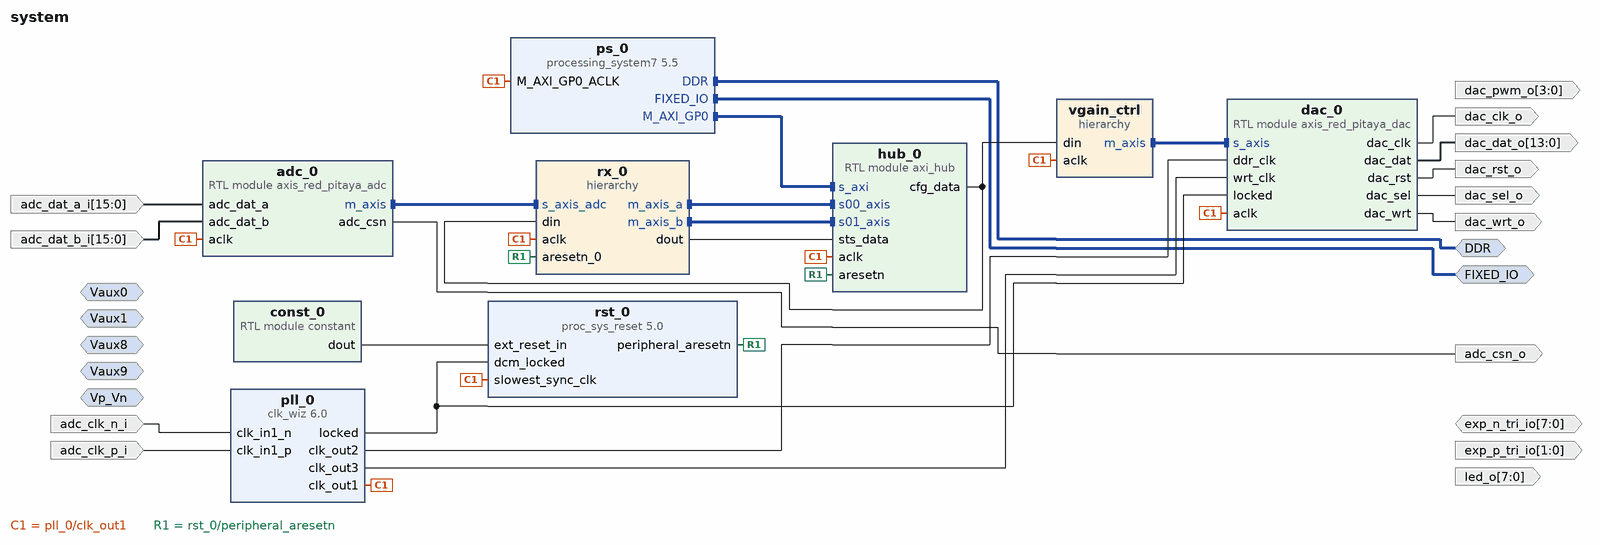
[diagram p0: block diagram of the top level]
# Vivado block design system, xc7z010clg400-1, Vivado 2025.2
create_bd_design system

create_bd_intf_port -mode Slave -vlnv xilinx.com:interface:diff_analog_io_rtl:1.0 Vp_Vn
create_bd_intf_port -mode Slave -vlnv xilinx.com:interface:diff_analog_io_rtl:1.0 Vaux0
create_bd_intf_port -mode Slave -vlnv xilinx.com:interface:diff_analog_io_rtl:1.0 Vaux1
create_bd_intf_port -mode Slave -vlnv xilinx.com:interface:diff_analog_io_rtl:1.0 Vaux9
create_bd_intf_port -mode Slave -vlnv xilinx.com:interface:diff_analog_io_rtl:1.0 Vaux8
create_bd_intf_port -mode Master -vlnv xilinx.com:interface:ddrx_rtl:1.0 DDR
create_bd_intf_port -mode Master -vlnv xilinx.com:display_processing_system7:fixedio_rtl:1.0 FIXED_IO
create_bd_port -dir I -from 15 -to 0 adc_dat_a_i
create_bd_port -dir I -from 15 -to 0 adc_dat_b_i
create_bd_port -dir I adc_clk_p_i
create_bd_port -dir I adc_clk_n_i
create_bd_port -dir O adc_csn_o
create_bd_port -dir O -from 13 -to 0 dac_dat_o
create_bd_port -dir O dac_clk_o
create_bd_port -dir O dac_rst_o
create_bd_port -dir O dac_sel_o
create_bd_port -dir O dac_wrt_o
create_bd_port -dir O -from 3 -to 0 dac_pwm_o
create_bd_port -dir IO -from 7 -to 0 exp_n_tri_io
create_bd_port -dir O -from 7 -to 0 led_o
create_bd_port -dir O -from 1 -to 0 exp_p_tri_io

create_bd_cell -type ip -vlnv xilinx.com:ip:clk_wiz:6.0 pll_0
set_property -dict [list \
  CONFIG.CLKOUT1_REQUESTED_OUT_FREQ 125.0 \
  CONFIG.CLKOUT1_USED true \
  CONFIG.CLKOUT2_REQUESTED_OUT_FREQ 250.0 \
  CONFIG.CLKOUT2_REQUESTED_PHASE 157.5 \
  CONFIG.CLKOUT2_USED true \
  CONFIG.CLKOUT3_REQUESTED_OUT_FREQ 250.0 \
  CONFIG.CLKOUT3_REQUESTED_PHASE 202.5 \
  CONFIG.CLKOUT3_USED true \
  CONFIG.PRIMITIVE PLL \
  CONFIG.PRIM_IN_FREQ 125.0 \
  CONFIG.PRIM_SOURCE Differential_clock_capable_pin \
  CONFIG.USE_RESET false \
] [get_bd_cells pll_0]
create_bd_cell -type ip -vlnv xilinx.com:ip:processing_system7:5.5 ps_0
set_property -dict [list \
  CONFIG.PCW_APU_PERIPHERAL_FREQMHZ 666.666666 \
  CONFIG.PCW_ENET0_ENET0_IO {MIO 16 .. 27} \
  CONFIG.PCW_ENET0_GRP_MDIO_ENABLE 1 \
  CONFIG.PCW_ENET0_GRP_MDIO_IO {MIO 52 .. 53} \
  CONFIG.PCW_ENET0_PERIPHERAL_ENABLE 1 \
  CONFIG.PCW_ENET0_RESET_ENABLE 0 \
  CONFIG.PCW_ENET_RESET_ENABLE 1 \
  CONFIG.PCW_ENET_RESET_SELECT {Share reset pin} \
  CONFIG.PCW_FPGA0_PERIPHERAL_FREQMHZ 50 \
  CONFIG.PCW_FPGA1_PERIPHERAL_FREQMHZ 50 \
  CONFIG.PCW_GPIO_EMIO_GPIO_ENABLE 1 \
  CONFIG.PCW_GPIO_EMIO_GPIO_IO 64 \
  CONFIG.PCW_GPIO_MIO_GPIO_ENABLE 1 \
  CONFIG.PCW_GPIO_MIO_GPIO_IO MIO \
  CONFIG.PCW_GPIO_PERIPHERAL_ENABLE 1 \
  CONFIG.PCW_I2C0_GRP_INT_ENABLE 0 \
  CONFIG.PCW_I2C0_I2C0_IO {MIO 50 .. 51} \
  CONFIG.PCW_I2C0_PERIPHERAL_ENABLE 1 \
  CONFIG.PCW_I2C_PERIPHERAL_FREQMHZ 111.111115 \
  CONFIG.PCW_I2C_RESET_ENABLE 1 \
  CONFIG.PCW_I2C_RESET_SELECT {Share reset pin} \
  CONFIG.PCW_IMPORT_BOARD_PRESET cfg/red_pitaya.xml \
  CONFIG.PCW_PRESET_BANK1_VOLTAGE {LVCMOS 2.5V} \
  CONFIG.PCW_QSPI_PERIPHERAL_ENABLE 0 \
  CONFIG.PCW_SD0_GRP_CD_ENABLE 1 \
  CONFIG.PCW_SD0_GRP_CD_IO {MIO 46} \
  CONFIG.PCW_SD0_GRP_WP_ENABLE 1 \
  CONFIG.PCW_SD0_GRP_WP_IO {MIO 47} \
  CONFIG.PCW_SD0_PERIPHERAL_ENABLE 1 \
  CONFIG.PCW_SD0_SD0_IO {MIO 40 .. 45} \
  CONFIG.PCW_SDIO_PERIPHERAL_FREQMHZ 100 \
  CONFIG.PCW_SPI0_PERIPHERAL_ENABLE 1 \
  CONFIG.PCW_SPI0_SPI0_IO EMIO \
  CONFIG.PCW_SPI1_PERIPHERAL_ENABLE 1 \
  CONFIG.PCW_SPI1_SPI1_IO {MIO 10 .. 15} \
  CONFIG.PCW_UART0_PERIPHERAL_ENABLE 1 \
  CONFIG.PCW_UART0_UART0_IO {MIO 14 .. 15} \
  CONFIG.PCW_UART1_PERIPHERAL_ENABLE 1 \
  CONFIG.PCW_UART1_UART1_IO {MIO 8 .. 9} \
  CONFIG.PCW_UART_PERIPHERAL_FREQMHZ 100 \
  CONFIG.PCW_UIPARAM_DDR_BUS_WIDTH {16 Bit} \
  CONFIG.PCW_UIPARAM_DDR_FREQ_MHZ 533.333333 \
  CONFIG.PCW_UIPARAM_DDR_PARTNO {MT41J256M16 RE-125} \
  CONFIG.PCW_USB0_PERIPHERAL_ENABLE 1 \
  CONFIG.PCW_USB0_RESET_ENABLE 1 \
  CONFIG.PCW_USB0_RESET_IO {MIO 48} \
  CONFIG.PCW_USB0_USB0_IO {MIO 28 .. 39} \
  CONFIG.PCW_USB_RESET_ENABLE 1 \
  CONFIG.PCW_USB_RESET_SELECT {Share reset pin} \
] [get_bd_cells ps_0]
# 431 more settings of ps_0 are not shown: defaults, MIO pin electricals, DDR timing, and values the tool derives
create_bd_cell -type module -reference constant const_0
create_bd_cell -type ip -vlnv xilinx.com:ip:proc_sys_reset:5.0 rst_0
create_bd_cell -type module -reference axis_red_pitaya_adc adc_0
set_property -dict {CONFIG.ADC_DATA_WIDTH 14} [get_bd_cells adc_0]
create_bd_cell -type module -reference axis_red_pitaya_dac dac_0
set_property -dict {CONFIG.DAC_DATA_WIDTH 14} [get_bd_cells dac_0]
create_bd_cell -type hier rx_0
create_bd_cell -type hier vgain_ctrl
create_bd_cell -type module -reference axi_hub hub_0
set_property -dict {CONFIG.CFG_DATA_WIDTH 128 CONFIG.STS_DATA_WIDTH 320} [get_bd_cells hub_0]

# ---- hierarchy /rx_0 ----
current_bd_instance /rx_0
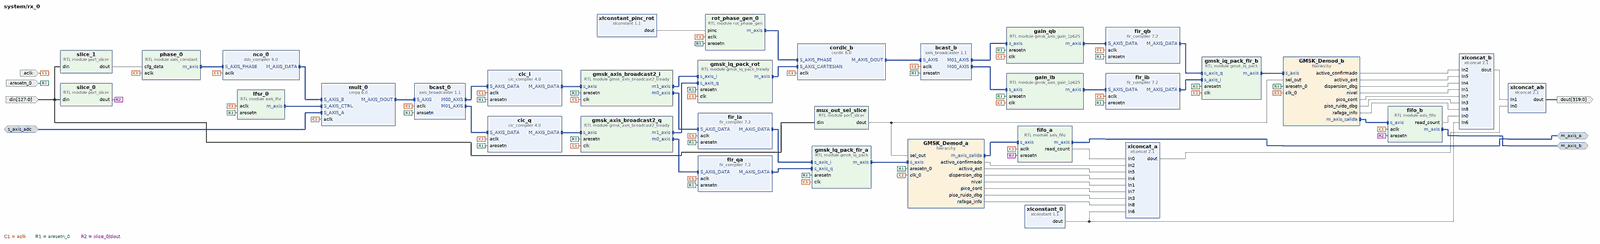
[diagram p1: block diagram inside /rx_0, whole]
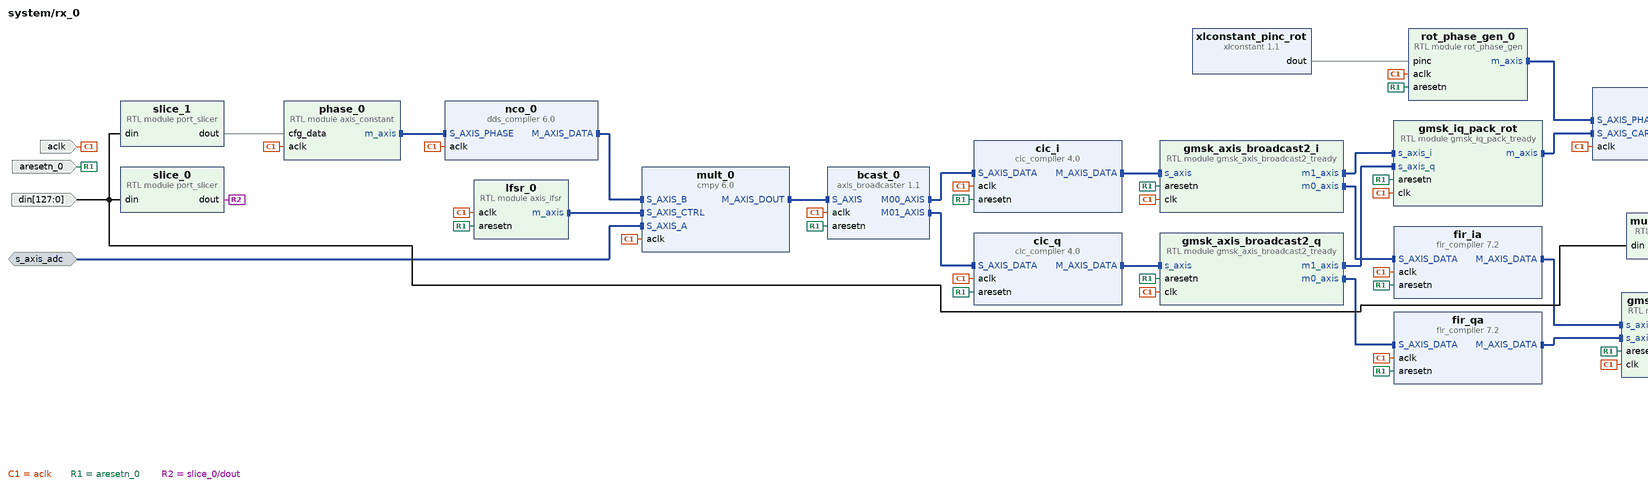
[diagram p2: block diagram inside /rx_0, left part]
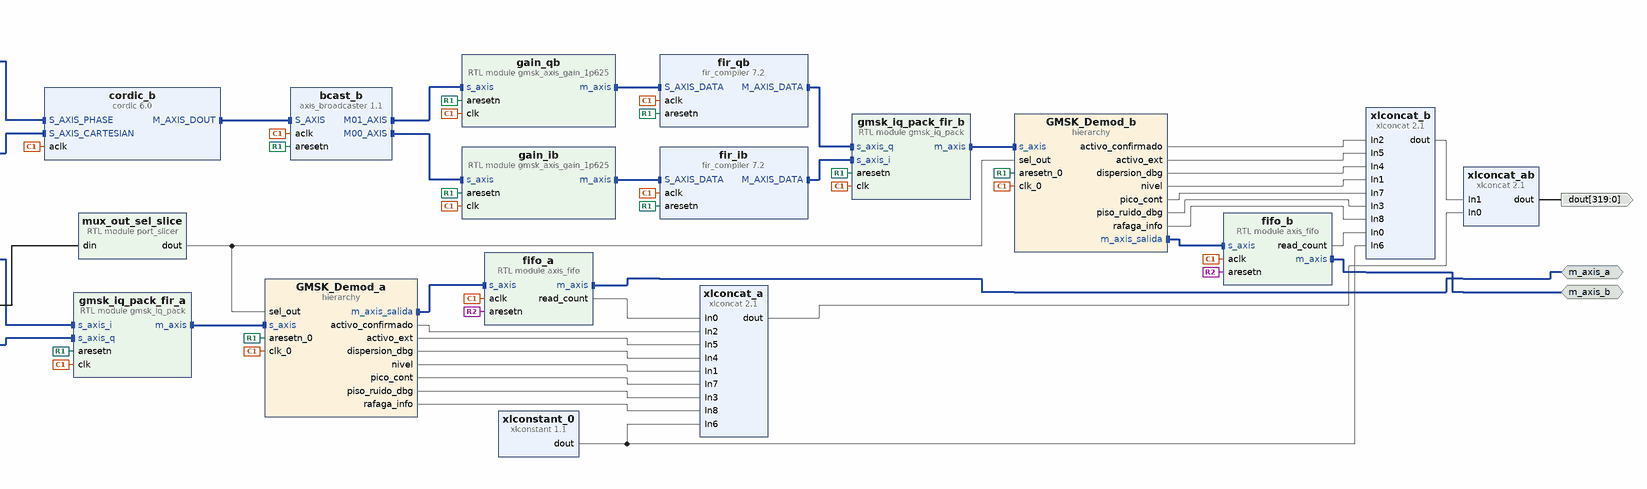
[diagram p3: block diagram inside /rx_0, right part]
create_bd_intf_pin -mode Slave -vlnv xilinx.com:interface:axis_rtl:1.0 s_axis_adc
create_bd_intf_pin -mode Master -vlnv xilinx.com:interface:axis_rtl:1.0 m_axis_a
create_bd_intf_pin -mode Master -vlnv xilinx.com:interface:axis_rtl:1.0 m_axis_b
create_bd_pin -dir I -type clk aclk
create_bd_pin -dir I -type rst aresetn_0
create_bd_pin -dir I -from 127 -to 0 din
create_bd_pin -dir O -from 319 -to 0 dout

create_bd_cell -type module -reference port_slicer slice_0
set_property -dict {CONFIG.DIN_FROM 0 CONFIG.DIN_TO 0 CONFIG.DIN_WIDTH 128} [get_bd_cells slice_0]
create_bd_cell -type module -reference port_slicer slice_1
set_property -dict {CONFIG.DIN_FROM 40 CONFIG.DIN_TO 1 CONFIG.DIN_WIDTH 128} [get_bd_cells slice_1]
create_bd_cell -type module -reference axis_constant phase_0
set_property -dict {CONFIG.AXIS_TDATA_WIDTH 40} [get_bd_cells phase_0]
create_bd_cell -type ip -vlnv xilinx.com:ip:dds_compiler:6.0 nco_0
set_property -dict [list \
  CONFIG.DDS_Clock_Rate 125 \
  CONFIG.DSP48_Use Minimal \
  CONFIG.Frequency_Resolution 0.2 \
  CONFIG.Has_Phase_Out false \
  CONFIG.Negative_Sine true \
  CONFIG.Output_Width 24 \
  CONFIG.Phase_Increment Streaming \
  CONFIG.Phase_Width 30 \
  CONFIG.Resync true \
  CONFIG.Spurious_Free_Dynamic_Range 138 \
] [get_bd_cells nco_0]
create_bd_cell -type module -reference axis_lfsr lfsr_0
create_bd_cell -type ip -vlnv xilinx.com:ip:cmpy:6.0 mult_0
set_property -dict [list \
  CONFIG.APortWidth 14 \
  CONFIG.BPortWidth 24 \
  CONFIG.OutputWidth 26 \
  CONFIG.RoundMode Random_Rounding \
] [get_bd_cells mult_0]
create_bd_cell -type ip -vlnv xilinx.com:ip:axis_broadcaster:1.1 bcast_0
set_property -dict [list \
  CONFIG.HAS_TKEEP 0 \
  CONFIG.HAS_TLAST 0 \
  CONFIG.HAS_TREADY 0 \
  CONFIG.HAS_TSTRB 0 \
  CONFIG.M00_TDATA_REMAP {tdata[23:0]} \
  CONFIG.M01_TDATA_REMAP {tdata[55:32]} \
  CONFIG.M_TDATA_NUM_BYTES 3 \
  CONFIG.M_TUSER_WIDTH 0 \
  CONFIG.S_TDATA_NUM_BYTES 8 \
  CONFIG.S_TUSER_WIDTH 0 \
  CONFIG.TDEST_WIDTH 0 \
  CONFIG.TID_WIDTH 0 \
] [get_bd_cells bcast_0]
create_bd_cell -type ip -vlnv xilinx.com:ip:cic_compiler:4.0 cic_i
set_property -dict [list \
  CONFIG.Clock_Frequency 125 \
  CONFIG.Filter_Type Decimation \
  CONFIG.Fixed_Or_Initial_Rate 651 \
  CONFIG.HAS_ARESETN true \
  CONFIG.HAS_DOUT_TREADY true \
  CONFIG.Input_Data_Width 24 \
  CONFIG.Input_Sample_Frequency 125 \
  CONFIG.Maximum_Rate 651 \
  CONFIG.Minimum_Rate 651 \
  CONFIG.Number_Of_Stages 6 \
  CONFIG.Output_Data_Width 32 \
  CONFIG.Quantization Truncation \
  CONFIG.SamplePeriod 1 \
  CONFIG.Sample_Rate_Changes Fixed \
  CONFIG.Use_Xtreme_DSP_Slice false \
] [get_bd_cells cic_i]
create_bd_cell -type module -reference axis_fifo fifo_a
set_property -dict [list \
  CONFIG.ALWAYS_READY FALSE \
  CONFIG.M_AXIS_TDATA_WIDTH 32 \
  CONFIG.S_AXIS_TDATA_WIDTH 32 \
  CONFIG.WRITE_DEPTH 16 \
] [get_bd_cells fifo_a]
create_bd_cell -type ip -vlnv xilinx.com:ip:cic_compiler:4.0 cic_q
set_property -dict [list \
  CONFIG.Clock_Frequency 125 \
  CONFIG.Filter_Type Decimation \
  CONFIG.Fixed_Or_Initial_Rate 651 \
  CONFIG.HAS_ARESETN true \
  CONFIG.HAS_DOUT_TREADY true \
  CONFIG.Input_Data_Width 24 \
  CONFIG.Input_Sample_Frequency 125 \
  CONFIG.Maximum_Rate 651 \
  CONFIG.Minimum_Rate 651 \
  CONFIG.Number_Of_Stages 6 \
  CONFIG.Output_Data_Width 32 \
  CONFIG.Quantization Truncation \
  CONFIG.SamplePeriod 1 \
  CONFIG.Sample_Rate_Changes Fixed \
  CONFIG.Use_Xtreme_DSP_Slice false \
] [get_bd_cells cic_q]
create_bd_cell -type ip -vlnv xilinx.com:ip:fir_compiler:7.2 fir_ia
set_property -dict [list \
  CONFIG.BestPrecision true \
  CONFIG.Clock_Frequency 125 \
  CONFIG.CoefficientVector {['1.1896509788e-07, 6.9660228675e-05, 1.8425018915e-04, 3.2960570394e-04, 4.7279860336e-04, 5.6454358018e-04, 5.4730828786e-04, 3.6883610405e-04, -9.5501433577e-07, -5.5323682079e-04, -1.2281903741e-03,', '-1.9121033747e-03, -2.4470597682e-03, -2.6544152007e-03, -2.3702213517e-03, -1.4874792911e-03, 2.7116524257e-06, 1.9806444192e-03, 4.1874630308e-03, 6.2416178231e-03, 7.6850822476e-03,', '8.0564557276e-03, 6.9820306278e-03, 4.2706497456e-03, -5.0750014526e-06, -5.4589249828e-03, -1.1387267116e-02, -1.6819594829e-02, -2.0623007315e-02, -2.1650489475e-02, -1.8913867874e-02,', '-1.1755829839e-02, 7.1619023374e-06, 1.5997042827e-02, 3.5260495169e-02, 5.6337852597e-02, 7.7410091897e-02, 9.6506595624e-02, 1.1174577702e-01, 1.2157425767e-01, 1.2496933198e-01, 1.2157425767e-01,', '1.1174577702e-01, 9.6506595624e-02, 7.7410091897e-02, 5.6337852597e-02, 3.5260495169e-02, 1.5997042827e-02, 7.1619023374e-06, -1.1755829839e-02, -1.8913867874e-02, -2.1650489475e-02,', '-2.0623007315e-02, -1.6819594829e-02, -1.1387267116e-02, -5.4589249828e-03, -5.0750014526e-06, 4.2706497456e-03, 6.9820306278e-03, 8.0564557276e-03, 7.6850822476e-03, 6.2416178231e-03,', '4.1874630308e-03, 1.9806444192e-03, 2.7116524257e-06, -1.4874792911e-03, -2.3702213517e-03, -2.6544152007e-03, -2.4470597682e-03, -1.9121033747e-03, -1.2281903741e-03, -5.5323682079e-04,', '-9.5501433577e-07, 3.6883610405e-04, 5.4730828786e-04, 5.6454358018e-04, 4.7279860336e-04, 3.2960570394e-04, 1.8425018915e-04, 6.9660228675e-05, 1.1896509788e-07']} \
  CONFIG.Coefficient_Fractional_Bits 26 \
  CONFIG.Coefficient_Sets 1 \
  CONFIG.Coefficient_Sign Signed \
  CONFIG.Coefficient_Structure Inferred \
  CONFIG.Coefficient_Width 24 \
  CONFIG.ColumnConfig 1 \
  CONFIG.DATA_Has_TLAST Not_Required \
  CONFIG.Data_Width 32 \
  CONFIG.Decimation_Rate 1 \
  CONFIG.Filter_Architecture Systolic_Multiply_Accumulate \
  CONFIG.Filter_Type Single_Rate \
  CONFIG.Has_ARESETn true \
  CONFIG.Interpolation_Rate 1 \
  CONFIG.M_DATA_Has_TUSER Not_Required \
  CONFIG.Number_Channels 1 \
  CONFIG.Number_Paths 1 \
  CONFIG.Output_Rounding_Mode Convergent_Rounding_to_Even \
  CONFIG.Output_Width 32 \
  CONFIG.Quantization Quantize_Only \
  CONFIG.RateSpecification Frequency_Specification \
  CONFIG.S_DATA_Has_TUSER Not_Required \
  CONFIG.Sample_Frequency 0.192012289 \
  CONFIG.Select_Pattern All \
  CONFIG.Zero_Pack_Factor 1 \
] [get_bd_cells fir_ia]
create_bd_cell -type hier GMSK_Demod_a
create_bd_cell -type ip -vlnv xilinx.com:ip:fir_compiler:7.2 fir_qa
set_property -dict [list \
  CONFIG.BestPrecision true \
  CONFIG.Clock_Frequency 125 \
  CONFIG.CoefficientVector {['1.1896509788e-07, 6.9660228675e-05, 1.8425018915e-04, 3.2960570394e-04, 4.7279860336e-04, 5.6454358018e-04, 5.4730828786e-04, 3.6883610405e-04, -9.5501433577e-07, -5.5323682079e-04, -1.2281903741e-03,', '-1.9121033747e-03, -2.4470597682e-03, -2.6544152007e-03, -2.3702213517e-03, -1.4874792911e-03, 2.7116524257e-06, 1.9806444192e-03, 4.1874630308e-03, 6.2416178231e-03, 7.6850822476e-03,', '8.0564557276e-03, 6.9820306278e-03, 4.2706497456e-03, -5.0750014526e-06, -5.4589249828e-03, -1.1387267116e-02, -1.6819594829e-02, -2.0623007315e-02, -2.1650489475e-02, -1.8913867874e-02,', '-1.1755829839e-02, 7.1619023374e-06, 1.5997042827e-02, 3.5260495169e-02, 5.6337852597e-02, 7.7410091897e-02, 9.6506595624e-02, 1.1174577702e-01, 1.2157425767e-01, 1.2496933198e-01, 1.2157425767e-01,', '1.1174577702e-01, 9.6506595624e-02, 7.7410091897e-02, 5.6337852597e-02, 3.5260495169e-02, 1.5997042827e-02, 7.1619023374e-06, -1.1755829839e-02, -1.8913867874e-02, -2.1650489475e-02,', '-2.0623007315e-02, -1.6819594829e-02, -1.1387267116e-02, -5.4589249828e-03, -5.0750014526e-06, 4.2706497456e-03, 6.9820306278e-03, 8.0564557276e-03, 7.6850822476e-03, 6.2416178231e-03,', '4.1874630308e-03, 1.9806444192e-03, 2.7116524257e-06, -1.4874792911e-03, -2.3702213517e-03, -2.6544152007e-03, -2.4470597682e-03, -1.9121033747e-03, -1.2281903741e-03, -5.5323682079e-04,', '-9.5501433577e-07, 3.6883610405e-04, 5.4730828786e-04, 5.6454358018e-04, 4.7279860336e-04, 3.2960570394e-04, 1.8425018915e-04, 6.9660228675e-05, 1.1896509788e-07']} \
  CONFIG.Coefficient_Fractional_Bits 26 \
  CONFIG.Coefficient_Sets 1 \
  CONFIG.Coefficient_Sign Signed \
  CONFIG.Coefficient_Structure Inferred \
  CONFIG.Coefficient_Width 24 \
  CONFIG.ColumnConfig 1 \
  CONFIG.DATA_Has_TLAST Not_Required \
  CONFIG.Data_Width 32 \
  CONFIG.Decimation_Rate 1 \
  CONFIG.Filter_Architecture Systolic_Multiply_Accumulate \
  CONFIG.Filter_Type Single_Rate \
  CONFIG.Has_ARESETn true \
  CONFIG.Interpolation_Rate 1 \
  CONFIG.M_DATA_Has_TUSER Not_Required \
  CONFIG.Number_Channels 1 \
  CONFIG.Number_Paths 1 \
  CONFIG.Output_Rounding_Mode Convergent_Rounding_to_Even \
  CONFIG.Output_Width 32 \
  CONFIG.Quantization Quantize_Only \
  CONFIG.RateSpecification Frequency_Specification \
  CONFIG.S_DATA_Has_TUSER Not_Required \
  CONFIG.Sample_Frequency 0.192012289 \
  CONFIG.Select_Pattern All \
  CONFIG.Zero_Pack_Factor 1 \
] [get_bd_cells fir_qa]
create_bd_cell -type module -reference port_slicer mux_out_sel_slice
set_property -dict {CONFIG.DIN_FROM 96 CONFIG.DIN_TO 96 CONFIG.DIN_WIDTH 128} [get_bd_cells mux_out_sel_slice]
create_bd_cell -type module -reference gmsk_iq_pack gmsk_iq_pack_fir_a
create_bd_cell -type ip -vlnv xilinx.com:ip:xlconcat:2.1 xlconcat_a
set_property -dict [list \
  CONFIG.IN0_WIDTH 16 \
  CONFIG.IN1_WIDTH 20 \
  CONFIG.IN2_WIDTH 1 \
  CONFIG.IN3_WIDTH 20 \
  CONFIG.IN4_WIDTH 20 \
  CONFIG.IN5_WIDTH 1 \
  CONFIG.IN6_WIDTH 18 \
  CONFIG.IN7_WIDTH 32 \
  CONFIG.IN8_WIDTH 32 \
  CONFIG.NUM_PORTS 9 \
] [get_bd_cells xlconcat_a]
create_bd_cell -type ip -vlnv xilinx.com:ip:xlconstant:1.1 xlconstant_0
set_property -dict {CONFIG.CONST_VAL 0 CONFIG.CONST_WIDTH 18} [get_bd_cells xlconstant_0]
create_bd_cell -type ip -vlnv xilinx.com:ip:fir_compiler:7.2 fir_ib
set_property -dict [list \
  CONFIG.BestPrecision true \
  CONFIG.Clock_Frequency 125 \
  CONFIG.CoefficientVector {['1.1896509788e-07, 6.9660228675e-05, 1.8425018915e-04, 3.2960570394e-04, 4.7279860336e-04, 5.6454358018e-04, 5.4730828786e-04, 3.6883610405e-04, -9.5501433577e-07, -5.5323682079e-04, -1.2281903741e-03,', '-1.9121033747e-03, -2.4470597682e-03, -2.6544152007e-03, -2.3702213517e-03, -1.4874792911e-03, 2.7116524257e-06, 1.9806444192e-03, 4.1874630308e-03, 6.2416178231e-03, 7.6850822476e-03,', '8.0564557276e-03, 6.9820306278e-03, 4.2706497456e-03, -5.0750014526e-06, -5.4589249828e-03, -1.1387267116e-02, -1.6819594829e-02, -2.0623007315e-02, -2.1650489475e-02, -1.8913867874e-02,', '-1.1755829839e-02, 7.1619023374e-06, 1.5997042827e-02, 3.5260495169e-02, 5.6337852597e-02, 7.7410091897e-02, 9.6506595624e-02, 1.1174577702e-01, 1.2157425767e-01, 1.2496933198e-01, 1.2157425767e-01,', '1.1174577702e-01, 9.6506595624e-02, 7.7410091897e-02, 5.6337852597e-02, 3.5260495169e-02, 1.5997042827e-02, 7.1619023374e-06, -1.1755829839e-02, -1.8913867874e-02, -2.1650489475e-02,', '-2.0623007315e-02, -1.6819594829e-02, -1.1387267116e-02, -5.4589249828e-03, -5.0750014526e-06, 4.2706497456e-03, 6.9820306278e-03, 8.0564557276e-03, 7.6850822476e-03, 6.2416178231e-03,', '4.1874630308e-03, 1.9806444192e-03, 2.7116524257e-06, -1.4874792911e-03, -2.3702213517e-03, -2.6544152007e-03, -2.4470597682e-03, -1.9121033747e-03, -1.2281903741e-03, -5.5323682079e-04,', '-9.5501433577e-07, 3.6883610405e-04, 5.4730828786e-04, 5.6454358018e-04, 4.7279860336e-04, 3.2960570394e-04, 1.8425018915e-04, 6.9660228675e-05, 1.1896509788e-07']} \
  CONFIG.Coefficient_Fractional_Bits 26 \
  CONFIG.Coefficient_Sets 1 \
  CONFIG.Coefficient_Sign Signed \
  CONFIG.Coefficient_Structure Inferred \
  CONFIG.Coefficient_Width 24 \
  CONFIG.ColumnConfig 1 \
  CONFIG.DATA_Has_TLAST Not_Required \
  CONFIG.Data_Width 32 \
  CONFIG.Decimation_Rate 1 \
  CONFIG.Filter_Architecture Systolic_Multiply_Accumulate \
  CONFIG.Filter_Type Single_Rate \
  CONFIG.Has_ARESETn true \
  CONFIG.Interpolation_Rate 1 \
  CONFIG.M_DATA_Has_TUSER Not_Required \
  CONFIG.Number_Channels 1 \
  CONFIG.Number_Paths 1 \
  CONFIG.Output_Rounding_Mode Convergent_Rounding_to_Even \
  CONFIG.Output_Width 32 \
  CONFIG.Quantization Quantize_Only \
  CONFIG.RateSpecification Frequency_Specification \
  CONFIG.S_DATA_Has_TUSER Not_Required \
  CONFIG.Sample_Frequency 0.192012289 \
  CONFIG.Select_Pattern All \
  CONFIG.Zero_Pack_Factor 1 \
] [get_bd_cells fir_ib]
create_bd_cell -type ip -vlnv xilinx.com:ip:fir_compiler:7.2 fir_qb
set_property -dict [list \
  CONFIG.BestPrecision true \
  CONFIG.Clock_Frequency 125 \
  CONFIG.CoefficientVector {['1.1896509788e-07, 6.9660228675e-05, 1.8425018915e-04, 3.2960570394e-04, 4.7279860336e-04, 5.6454358018e-04, 5.4730828786e-04, 3.6883610405e-04, -9.5501433577e-07, -5.5323682079e-04, -1.2281903741e-03,', '-1.9121033747e-03, -2.4470597682e-03, -2.6544152007e-03, -2.3702213517e-03, -1.4874792911e-03, 2.7116524257e-06, 1.9806444192e-03, 4.1874630308e-03, 6.2416178231e-03, 7.6850822476e-03,', '8.0564557276e-03, 6.9820306278e-03, 4.2706497456e-03, -5.0750014526e-06, -5.4589249828e-03, -1.1387267116e-02, -1.6819594829e-02, -2.0623007315e-02, -2.1650489475e-02, -1.8913867874e-02,', '-1.1755829839e-02, 7.1619023374e-06, 1.5997042827e-02, 3.5260495169e-02, 5.6337852597e-02, 7.7410091897e-02, 9.6506595624e-02, 1.1174577702e-01, 1.2157425767e-01, 1.2496933198e-01, 1.2157425767e-01,', '1.1174577702e-01, 9.6506595624e-02, 7.7410091897e-02, 5.6337852597e-02, 3.5260495169e-02, 1.5997042827e-02, 7.1619023374e-06, -1.1755829839e-02, -1.8913867874e-02, -2.1650489475e-02,', '-2.0623007315e-02, -1.6819594829e-02, -1.1387267116e-02, -5.4589249828e-03, -5.0750014526e-06, 4.2706497456e-03, 6.9820306278e-03, 8.0564557276e-03, 7.6850822476e-03, 6.2416178231e-03,', '4.1874630308e-03, 1.9806444192e-03, 2.7116524257e-06, -1.4874792911e-03, -2.3702213517e-03, -2.6544152007e-03, -2.4470597682e-03, -1.9121033747e-03, -1.2281903741e-03, -5.5323682079e-04,', '-9.5501433577e-07, 3.6883610405e-04, 5.4730828786e-04, 5.6454358018e-04, 4.7279860336e-04, 3.2960570394e-04, 1.8425018915e-04, 6.9660228675e-05, 1.1896509788e-07']} \
  CONFIG.Coefficient_Fractional_Bits 26 \
  CONFIG.Coefficient_Sets 1 \
  CONFIG.Coefficient_Sign Signed \
  CONFIG.Coefficient_Structure Inferred \
  CONFIG.Coefficient_Width 24 \
  CONFIG.ColumnConfig 1 \
  CONFIG.DATA_Has_TLAST Not_Required \
  CONFIG.Data_Width 32 \
  CONFIG.Decimation_Rate 1 \
  CONFIG.Filter_Architecture Systolic_Multiply_Accumulate \
  CONFIG.Filter_Type Single_Rate \
  CONFIG.Has_ARESETn true \
  CONFIG.Interpolation_Rate 1 \
  CONFIG.M_DATA_Has_TUSER Not_Required \
  CONFIG.Number_Channels 1 \
  CONFIG.Number_Paths 1 \
  CONFIG.Output_Rounding_Mode Convergent_Rounding_to_Even \
  CONFIG.Output_Width 32 \
  CONFIG.Quantization Quantize_Only \
  CONFIG.RateSpecification Frequency_Specification \
  CONFIG.S_DATA_Has_TUSER Not_Required \
  CONFIG.Sample_Frequency 0.192012289 \
  CONFIG.Select_Pattern All \
  CONFIG.Zero_Pack_Factor 1 \
] [get_bd_cells fir_qb]
create_bd_cell -type module -reference gmsk_iq_pack gmsk_iq_pack_fir_b
create_bd_cell -type hier GMSK_Demod_b
create_bd_cell -type module -reference axis_fifo fifo_b
set_property -dict [list \
  CONFIG.ALWAYS_READY FALSE \
  CONFIG.M_AXIS_TDATA_WIDTH 32 \
  CONFIG.S_AXIS_TDATA_WIDTH 32 \
  CONFIG.WRITE_DEPTH 16 \
] [get_bd_cells fifo_b]
create_bd_cell -type ip -vlnv xilinx.com:ip:xlconcat:2.1 xlconcat_b
set_property -dict [list \
  CONFIG.IN0_WIDTH 16 \
  CONFIG.IN1_WIDTH 20 \
  CONFIG.IN2_WIDTH 1 \
  CONFIG.IN3_WIDTH 20 \
  CONFIG.IN4_WIDTH 20 \
  CONFIG.IN5_WIDTH 1 \
  CONFIG.IN6_WIDTH 18 \
  CONFIG.IN7_WIDTH 32 \
  CONFIG.IN8_WIDTH 32 \
  CONFIG.NUM_PORTS 9 \
] [get_bd_cells xlconcat_b]
create_bd_cell -type ip -vlnv xilinx.com:ip:xlconcat:2.1 xlconcat_ab
set_property -dict {CONFIG.IN0_WIDTH 160 CONFIG.IN1_WIDTH 160} [get_bd_cells xlconcat_ab]
create_bd_cell -type ip -vlnv xilinx.com:ip:cordic:6.0 cordic_b
set_property -dict [list \
  CONFIG.ARESETN false \
  CONFIG.Architectural_Configuration Word_Serial \
  CONFIG.Input_Width 32 \
  CONFIG.Output_Width 32 \
  CONFIG.Phase_Format Scaled_Radians \
  CONFIG.Pipelining_Mode Maximum \
  CONFIG.flow_control Blocking \
  CONFIG.optimize_goal Resources \
  CONFIG.out_tready true \
] [get_bd_cells cordic_b]
create_bd_cell -type module -reference rot_phase_gen rot_phase_gen_0
set_property -dict {CONFIG.ACC_WIDTH 30 CONFIG.OUT_WIDTH 32} [get_bd_cells rot_phase_gen_0]
create_bd_cell -type ip -vlnv xilinx.com:ip:axis_broadcaster:1.1 bcast_b
set_property -dict [list \
  CONFIG.HAS_TKEEP 0 \
  CONFIG.HAS_TLAST 0 \
  CONFIG.HAS_TREADY 1 \
  CONFIG.HAS_TSTRB 0 \
  CONFIG.M00_TDATA_REMAP {tdata[31:0]} \
  CONFIG.M01_TDATA_REMAP {tdata[63:32]} \
  CONFIG.M_TDATA_NUM_BYTES 4 \
  CONFIG.M_TUSER_WIDTH 0 \
  CONFIG.S_TDATA_NUM_BYTES 8 \
  CONFIG.S_TUSER_WIDTH 0 \
  CONFIG.TDEST_WIDTH 0 \
  CONFIG.TID_WIDTH 0 \
] [get_bd_cells bcast_b]
create_bd_cell -type ip -vlnv xilinx.com:ip:xlconstant:1.1 xlconstant_pinc_rot
set_property -dict {CONFIG.CONST_VAL 794139453 CONFIG.CONST_WIDTH 30} [get_bd_cells xlconstant_pinc_rot]
create_bd_cell -type module -reference gmsk_axis_broadcast2_tready gmsk_axis_broadcast2_q
set_property -dict {CONFIG.DATA_WIDTH 32} [get_bd_cells gmsk_axis_broadcast2_q]
create_bd_cell -type module -reference gmsk_axis_broadcast2_tready gmsk_axis_broadcast2_i
set_property -dict {CONFIG.DATA_WIDTH 32} [get_bd_cells gmsk_axis_broadcast2_i]
create_bd_cell -type module -reference gmsk_iq_pack_tready gmsk_iq_pack_rot
create_bd_cell -type module -reference gmsk_axis_gain_1p625 gain_ib
create_bd_cell -type module -reference gmsk_axis_gain_1p625 gain_qb

# ---- hierarchy /rx_0/GMSK_Demod_a ----
current_bd_instance /rx_0/GMSK_Demod_a
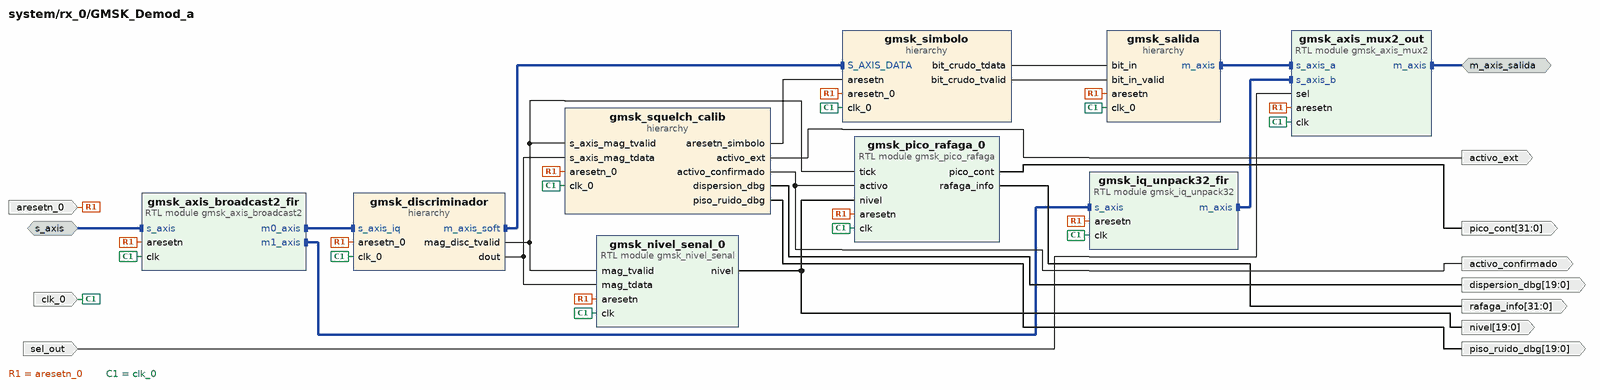
[diagram p4: block diagram inside /rx_0/GMSK_Demod_a]
create_bd_intf_pin -mode Master -vlnv xilinx.com:interface:axis_rtl:1.0 m_axis_salida
create_bd_intf_pin -mode Slave -vlnv xilinx.com:interface:axis_rtl:1.0 s_axis
create_bd_pin -dir I -type clk clk_0
create_bd_pin -dir I -type rst aresetn_0
create_bd_pin -dir I sel_out
create_bd_pin -dir O -from 19 -to 0 nivel
create_bd_pin -dir O activo_confirmado
create_bd_pin -dir O -from 19 -to 0 piso_ruido_dbg
create_bd_pin -dir O -from 19 -to 0 dispersion_dbg
create_bd_pin -dir O activo_ext
create_bd_pin -dir O -from 31 -to 0 pico_cont
create_bd_pin -dir O -from 31 -to 0 rafaga_info

create_bd_cell -type hier gmsk_discriminador
create_bd_cell -type hier gmsk_squelch_calib
create_bd_cell -type hier gmsk_salida
create_bd_cell -type hier gmsk_simbolo
create_bd_cell -type module -reference gmsk_iq_unpack32 gmsk_iq_unpack32_fir
create_bd_cell -type module -reference gmsk_axis_broadcast2 gmsk_axis_broadcast2_fir
set_property -dict {CONFIG.DATA_WIDTH 64} [get_bd_cells gmsk_axis_broadcast2_fir]
create_bd_cell -type module -reference gmsk_axis_mux2 gmsk_axis_mux2_out
create_bd_cell -type module -reference gmsk_nivel_senal gmsk_nivel_senal_0
set_property -dict {CONFIG.DATA_WIDTH 20} [get_bd_cells gmsk_nivel_senal_0]
create_bd_cell -type module -reference gmsk_pico_rafaga gmsk_pico_rafaga_0

# ---- hierarchy /rx_0/GMSK_Demod_a/gmsk_discriminador ----
current_bd_instance /rx_0/GMSK_Demod_a/gmsk_discriminador
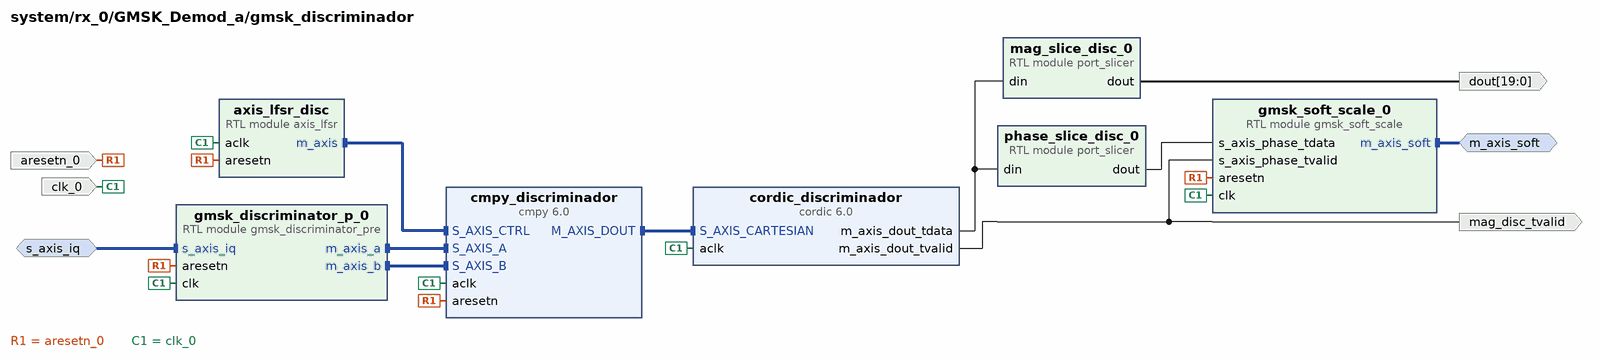
[diagram p5: block diagram inside /rx_0/GMSK_Demod_a/gmsk_discriminador]
create_bd_intf_pin -mode Slave -vlnv xilinx.com:interface:axis_rtl:1.0 s_axis_iq
create_bd_intf_pin -mode Master -vlnv xilinx.com:interface:axis_rtl:1.0 m_axis_soft
create_bd_pin -dir I -type clk clk_0
create_bd_pin -dir I -type rst aresetn_0
create_bd_pin -dir O mag_disc_tvalid
create_bd_pin -dir O -from 19 -to 0 dout

create_bd_cell -type ip -vlnv xilinx.com:ip:cmpy:6.0 cmpy_discriminador
set_property -dict [list \
  CONFIG.APortWidth 32 \
  CONFIG.ARESETN true \
  CONFIG.BPortWidth 32 \
  CONFIG.MinimumLatency 13 \
  CONFIG.OutputWidth 24 \
  CONFIG.RoundMode Random_Rounding \
] [get_bd_cells cmpy_discriminador]
create_bd_cell -type module -reference gmsk_discriminator_pre gmsk_discriminator_p_0
create_bd_cell -type ip -vlnv xilinx.com:ip:cordic:6.0 cordic_discriminador
set_property -dict [list \
  CONFIG.ARESETN false \
  CONFIG.Architectural_Configuration Parallel \
  CONFIG.Compensation_Scaling No_Scale_Compensation \
  CONFIG.Data_Format SignedFraction \
  CONFIG.Functional_Selection Translate \
  CONFIG.Input_Width 24 \
  CONFIG.Output_Width 20 \
  CONFIG.Phase_Format Radians \
  CONFIG.Pipelining_Mode Maximum \
] [get_bd_cells cordic_discriminador]
create_bd_cell -type module -reference gmsk_soft_scale gmsk_soft_scale_0
set_property -dict {CONFIG.PHASE_WIDTH 16} [get_bd_cells gmsk_soft_scale_0]
create_bd_cell -type module -reference axis_lfsr axis_lfsr_disc
create_bd_cell -type module -reference port_slicer phase_slice_disc_0
set_property -dict {CONFIG.DIN_FROM 43 CONFIG.DIN_TO 28 CONFIG.DIN_WIDTH 48} [get_bd_cells phase_slice_disc_0]
create_bd_cell -type module -reference port_slicer mag_slice_disc_0
set_property -dict {CONFIG.DIN_FROM 19 CONFIG.DIN_TO 0 CONFIG.DIN_WIDTH 48} [get_bd_cells mag_slice_disc_0]

# ---- hierarchy /rx_0/GMSK_Demod_a/gmsk_squelch_calib ----
current_bd_instance /rx_0/GMSK_Demod_a/gmsk_squelch_calib
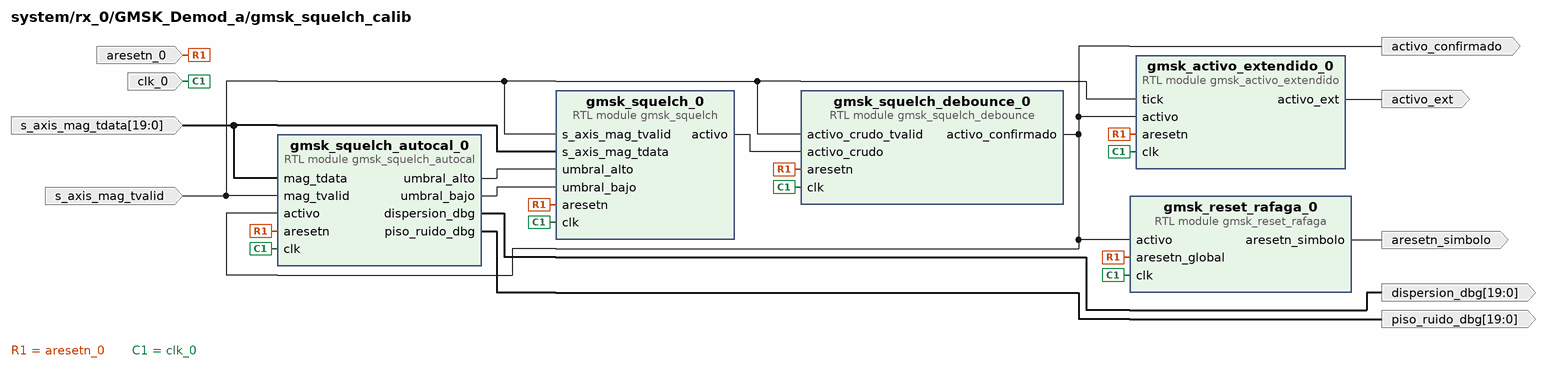
[diagram p6: block diagram inside /rx_0/GMSK_Demod_a/gmsk_squelch_calib]
create_bd_pin -dir I -type clk clk_0
create_bd_pin -dir I -type rst aresetn_0
create_bd_pin -dir O -type rst aresetn_simbolo
create_bd_pin -dir I s_axis_mag_tvalid
create_bd_pin -dir O activo_confirmado
create_bd_pin -dir I -from 19 -to 0 s_axis_mag_tdata
create_bd_pin -dir O -from 19 -to 0 piso_ruido_dbg
create_bd_pin -dir O -from 19 -to 0 dispersion_dbg
create_bd_pin -dir O activo_ext

create_bd_cell -type module -reference gmsk_squelch gmsk_squelch_0
set_property -dict {CONFIG.PHASE_WIDTH 20} [get_bd_cells gmsk_squelch_0]
create_bd_cell -type module -reference gmsk_reset_rafaga gmsk_reset_rafaga_0
set_property -dict {CONFIG.N_CICLOS_RESET 4} [get_bd_cells gmsk_reset_rafaga_0]
create_bd_cell -type module -reference gmsk_squelch_debounce gmsk_squelch_debounce_0
create_bd_cell -type module -reference gmsk_squelch_autocal gmsk_squelch_autocal_0
set_property -dict {CONFIG.DATA_WIDTH 20} [get_bd_cells gmsk_squelch_autocal_0]
create_bd_cell -type module -reference gmsk_activo_extendido gmsk_activo_extendido_0

# ---- hierarchy /rx_0/GMSK_Demod_a/gmsk_salida ----
current_bd_instance /rx_0/GMSK_Demod_a/gmsk_salida
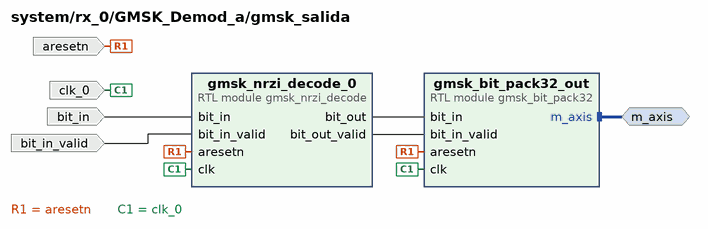
[diagram p7: block diagram inside /rx_0/GMSK_Demod_a/gmsk_salida]
create_bd_intf_pin -mode Master -vlnv xilinx.com:interface:axis_rtl:1.0 m_axis
create_bd_pin -dir I -type clk clk_0
create_bd_pin -dir I bit_in
create_bd_pin -dir I bit_in_valid
create_bd_pin -dir I -type rst aresetn

create_bd_cell -type module -reference gmsk_nrzi_decode gmsk_nrzi_decode_0
create_bd_cell -type module -reference gmsk_bit_pack32 gmsk_bit_pack32_out

# ---- hierarchy /rx_0/GMSK_Demod_a/gmsk_simbolo ----
current_bd_instance /rx_0/GMSK_Demod_a/gmsk_simbolo
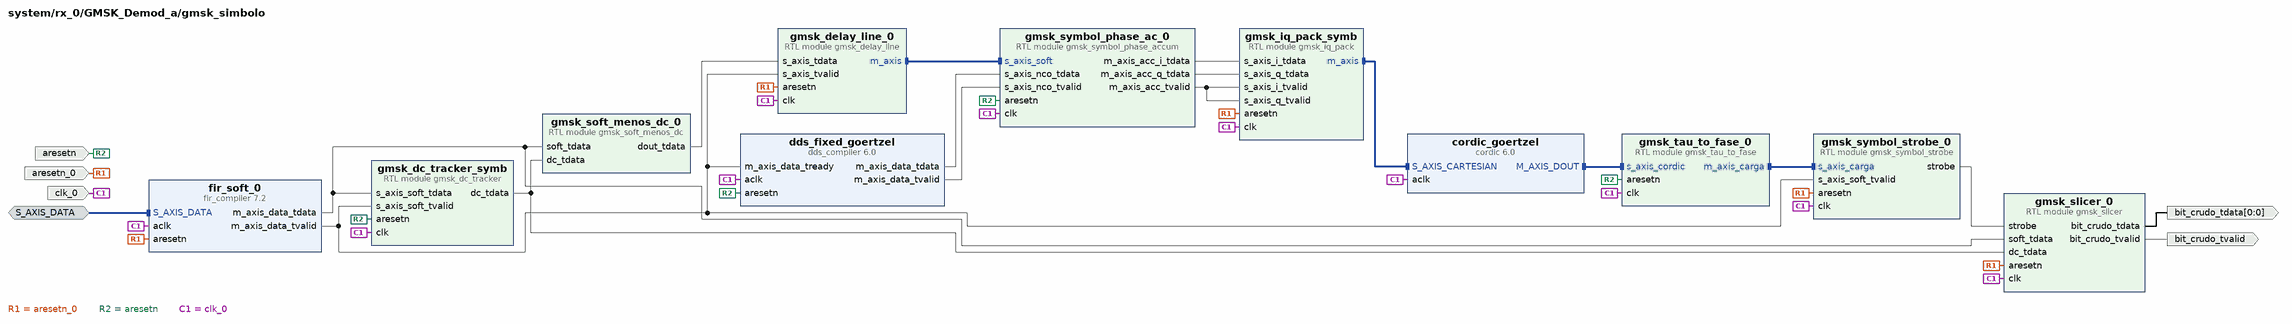
[diagram p8: block diagram inside /rx_0/GMSK_Demod_a/gmsk_simbolo]
create_bd_intf_pin -mode Slave -vlnv xilinx.com:interface:axis_rtl:1.0 S_AXIS_DATA
create_bd_pin -dir I -type clk clk_0
create_bd_pin -dir I -type rst aresetn_0
create_bd_pin -dir O -from 0 -to 0 bit_crudo_tdata
create_bd_pin -dir O bit_crudo_tvalid
create_bd_pin -dir I -type rst aresetn

create_bd_cell -type module -reference gmsk_slicer gmsk_slicer_0
create_bd_cell -type ip -vlnv xilinx.com:ip:cordic:6.0 cordic_goertzel
set_property -dict [list \
  CONFIG.ARESETN false \
  CONFIG.Architectural_Configuration Parallel \
  CONFIG.Compensation_Scaling No_Scale_Compensation \
  CONFIG.Data_Format SignedFraction \
  CONFIG.Functional_Selection Translate \
  CONFIG.Input_Width 24 \
  CONFIG.Output_Width 16 \
  CONFIG.Phase_Format Radians \
  CONFIG.Pipelining_Mode Maximum \
] [get_bd_cells cordic_goertzel]
create_bd_cell -type module -reference gmsk_delay_line gmsk_delay_line_0
set_property -dict {CONFIG.DELAY 12} [get_bd_cells gmsk_delay_line_0]
create_bd_cell -type ip -vlnv xilinx.com:ip:dds_compiler:6.0 dds_fixed_goertzel
set_property -dict [list \
  CONFIG.DATA_Has_TLAST Not_Required \
  CONFIG.DDS_Clock_Rate 0.192012289 \
  CONFIG.DSP48_Use Minimal \
  CONFIG.Frequency_Resolution 0.2 \
  CONFIG.Has_ARESETn true \
  CONFIG.Has_Phase_Out false \
  CONFIG.Has_TREADY true \
  CONFIG.Latency 12 \
  CONFIG.Negative_Sine true \
  CONFIG.Noise_Shaping Auto \
  CONFIG.OUTPUT_FORM Twos_Complement \
  CONFIG.Output_Frequency1 0.0096 \
  CONFIG.Output_Width 24 \
  CONFIG.PINC1 1100110011001001 \
  CONFIG.Phase_Increment Fixed \
  CONFIG.Phase_Width 20 \
  CONFIG.Resync false \
  CONFIG.S_PHASE_Has_TUSER Not_Required \
  CONFIG.Spurious_Free_Dynamic_Range 138 \
] [get_bd_cells dds_fixed_goertzel]
create_bd_cell -type module -reference gmsk_dc_tracker gmsk_dc_tracker_symb
set_property -dict {CONFIG.N_RAPIDO 400 CONFIG.SHIFT 12 CONFIG.SHIFT_RAPIDO 6} [get_bd_cells gmsk_dc_tracker_symb]
create_bd_cell -type module -reference gmsk_tau_to_fase gmsk_tau_to_fase_0
create_bd_cell -type module -reference gmsk_symbol_phase_accum gmsk_symbol_phase_ac_0
set_property -dict {CONFIG.N_BLOQUE 400 CONFIG.SHIFT_SALIDA 39} [get_bd_cells gmsk_symbol_phase_ac_0]
create_bd_cell -type module -reference gmsk_iq_pack gmsk_iq_pack_symb
set_property -dict {CONFIG.DATA_WIDTH 24} [get_bd_cells gmsk_iq_pack_symb]
create_bd_cell -type module -reference gmsk_soft_menos_dc gmsk_soft_menos_dc_0
create_bd_cell -type module -reference gmsk_symbol_strobe gmsk_symbol_strobe_0
set_property -dict {CONFIG.CORR_SHIFT 1} [get_bd_cells gmsk_symbol_strobe_0]
create_bd_cell -type ip -vlnv xilinx.com:ip:fir_compiler:7.2 fir_soft_0
set_property -dict [list \
  CONFIG.BestPrecision true \
  CONFIG.Clock_Frequency 125.0 \
  CONFIG.CoefficientVector {['-1.8496877595e-04, -3.1966502107e-04, -3.9983572604e-04, -3.3380304983e-04, 5.2790132615e-07, 7.4938218967e-04, 2.0714362252e-03, 4.1213150936e-03, 7.0296910521e-03, 1.0882164433e-02,', '1.5699626911e-02, 2.1422977056e-02, 2.7904815002e-02, 3.4910084326e-02, 4.2126619127e-02, 4.9185317972e-02, 5.5688373221e-02, 6.1242822589e-02, 6.5495838016e-02, 6.8167763599e-02, 6.9079035719e-02,', '6.8167763599e-02, 6.5495838016e-02, 6.1242822589e-02, 5.5688373221e-02, 4.9185317972e-02, 4.2126619127e-02, 3.4910084326e-02, 2.7904815002e-02, 2.1422977056e-02, 1.5699626911e-02, 1.0882164433e-02,', '7.0296910521e-03, 4.1213150936e-03, 2.0714362252e-03, 7.4938218967e-04, 5.2790132615e-07, -3.3380304983e-04, -3.9983572604e-04, -3.1966502107e-04, -1.8496877595e-04']} \
  CONFIG.Coefficient_Fractional_Bits 26 \
  CONFIG.Coefficient_Sets 1 \
  CONFIG.Coefficient_Sign Signed \
  CONFIG.Coefficient_Structure Inferred \
  CONFIG.Coefficient_Width 24 \
  CONFIG.Data_Fractional_Bits 23 \
  CONFIG.Data_Sign Signed \
  CONFIG.Data_Width 24 \
  CONFIG.Filter_Architecture Systolic_Multiply_Accumulate \
  CONFIG.Has_ARESETn true \
  CONFIG.M_DATA_Has_TREADY false \
  CONFIG.Output_Rounding_Mode Convergent_Rounding_to_Even \
  CONFIG.Output_Width 24 \
  CONFIG.Quantization Quantize_Only \
  CONFIG.Sample_Frequency 0.192012289 \
] [get_bd_cells fir_soft_0]

# ---- hierarchy /rx_0/GMSK_Demod_b ----
current_bd_instance /rx_0/GMSK_Demod_b
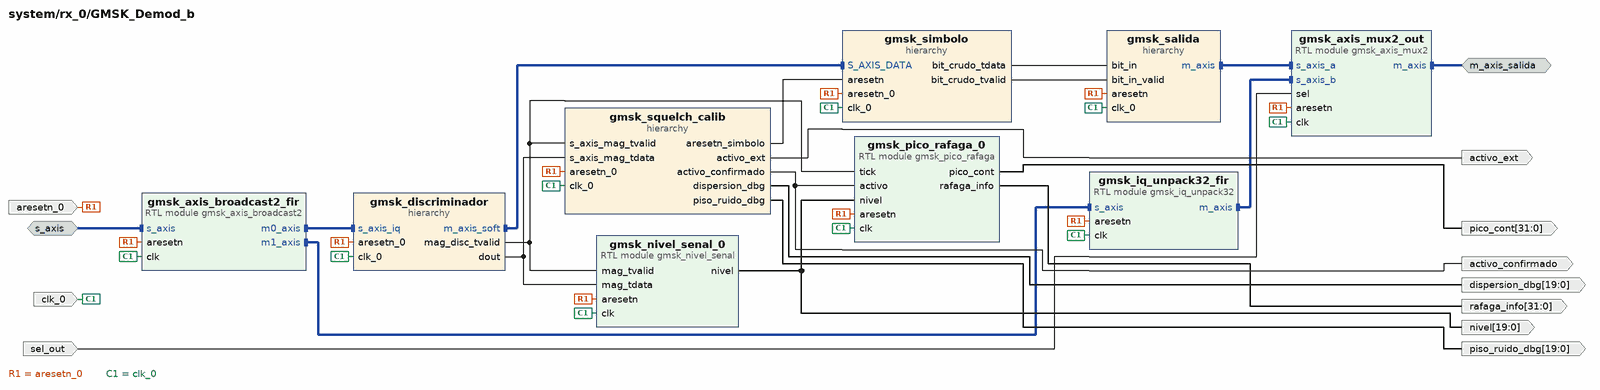
[diagram p9: block diagram inside /rx_0/GMSK_Demod_b]
create_bd_intf_pin -mode Master -vlnv xilinx.com:interface:axis_rtl:1.0 m_axis_salida
create_bd_intf_pin -mode Slave -vlnv xilinx.com:interface:axis_rtl:1.0 s_axis
create_bd_pin -dir I -type clk clk_0
create_bd_pin -dir I -type rst aresetn_0
create_bd_pin -dir I sel_out
create_bd_pin -dir O -from 19 -to 0 nivel
create_bd_pin -dir O activo_confirmado
create_bd_pin -dir O -from 19 -to 0 piso_ruido_dbg
create_bd_pin -dir O -from 19 -to 0 dispersion_dbg
create_bd_pin -dir O activo_ext
create_bd_pin -dir O -from 31 -to 0 pico_cont
create_bd_pin -dir O -from 31 -to 0 rafaga_info

create_bd_cell -type hier gmsk_discriminador
create_bd_cell -type hier gmsk_squelch_calib
create_bd_cell -type hier gmsk_salida
create_bd_cell -type hier gmsk_simbolo
create_bd_cell -type module -reference gmsk_iq_unpack32 gmsk_iq_unpack32_fir
create_bd_cell -type module -reference gmsk_axis_broadcast2 gmsk_axis_broadcast2_fir
set_property -dict {CONFIG.DATA_WIDTH 64} [get_bd_cells gmsk_axis_broadcast2_fir]
create_bd_cell -type module -reference gmsk_axis_mux2 gmsk_axis_mux2_out
create_bd_cell -type module -reference gmsk_nivel_senal gmsk_nivel_senal_0
set_property -dict {CONFIG.DATA_WIDTH 20} [get_bd_cells gmsk_nivel_senal_0]
create_bd_cell -type module -reference gmsk_pico_rafaga gmsk_pico_rafaga_0

# ---- hierarchy /rx_0/GMSK_Demod_b/gmsk_discriminador ----
current_bd_instance /rx_0/GMSK_Demod_b/gmsk_discriminador
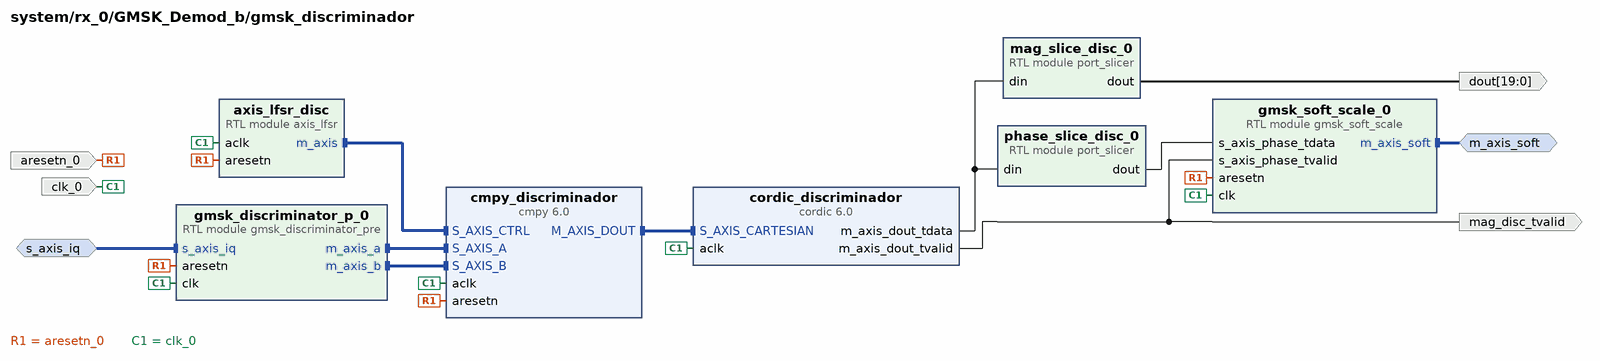
[diagram p10: block diagram inside /rx_0/GMSK_Demod_b/gmsk_discriminador]
create_bd_intf_pin -mode Slave -vlnv xilinx.com:interface:axis_rtl:1.0 s_axis_iq
create_bd_intf_pin -mode Master -vlnv xilinx.com:interface:axis_rtl:1.0 m_axis_soft
create_bd_pin -dir I -type clk clk_0
create_bd_pin -dir I -type rst aresetn_0
create_bd_pin -dir O mag_disc_tvalid
create_bd_pin -dir O -from 19 -to 0 dout

create_bd_cell -type ip -vlnv xilinx.com:ip:cmpy:6.0 cmpy_discriminador
set_property -dict [list \
  CONFIG.APortWidth 32 \
  CONFIG.ARESETN true \
  CONFIG.BPortWidth 32 \
  CONFIG.MinimumLatency 13 \
  CONFIG.OutputWidth 24 \
  CONFIG.RoundMode Random_Rounding \
] [get_bd_cells cmpy_discriminador]
create_bd_cell -type module -reference gmsk_discriminator_pre gmsk_discriminator_p_0
create_bd_cell -type ip -vlnv xilinx.com:ip:cordic:6.0 cordic_discriminador
set_property -dict [list \
  CONFIG.ARESETN false \
  CONFIG.Architectural_Configuration Parallel \
  CONFIG.Compensation_Scaling No_Scale_Compensation \
  CONFIG.Data_Format SignedFraction \
  CONFIG.Functional_Selection Translate \
  CONFIG.Input_Width 24 \
  CONFIG.Output_Width 20 \
  CONFIG.Phase_Format Radians \
  CONFIG.Pipelining_Mode Maximum \
] [get_bd_cells cordic_discriminador]
create_bd_cell -type module -reference gmsk_soft_scale gmsk_soft_scale_0
set_property -dict {CONFIG.PHASE_WIDTH 16} [get_bd_cells gmsk_soft_scale_0]
create_bd_cell -type module -reference axis_lfsr axis_lfsr_disc
create_bd_cell -type module -reference port_slicer phase_slice_disc_0
set_property -dict {CONFIG.DIN_FROM 43 CONFIG.DIN_TO 28 CONFIG.DIN_WIDTH 48} [get_bd_cells phase_slice_disc_0]
create_bd_cell -type module -reference port_slicer mag_slice_disc_0
set_property -dict {CONFIG.DIN_FROM 19 CONFIG.DIN_TO 0 CONFIG.DIN_WIDTH 48} [get_bd_cells mag_slice_disc_0]

# ---- hierarchy /rx_0/GMSK_Demod_b/gmsk_squelch_calib ----
current_bd_instance /rx_0/GMSK_Demod_b/gmsk_squelch_calib
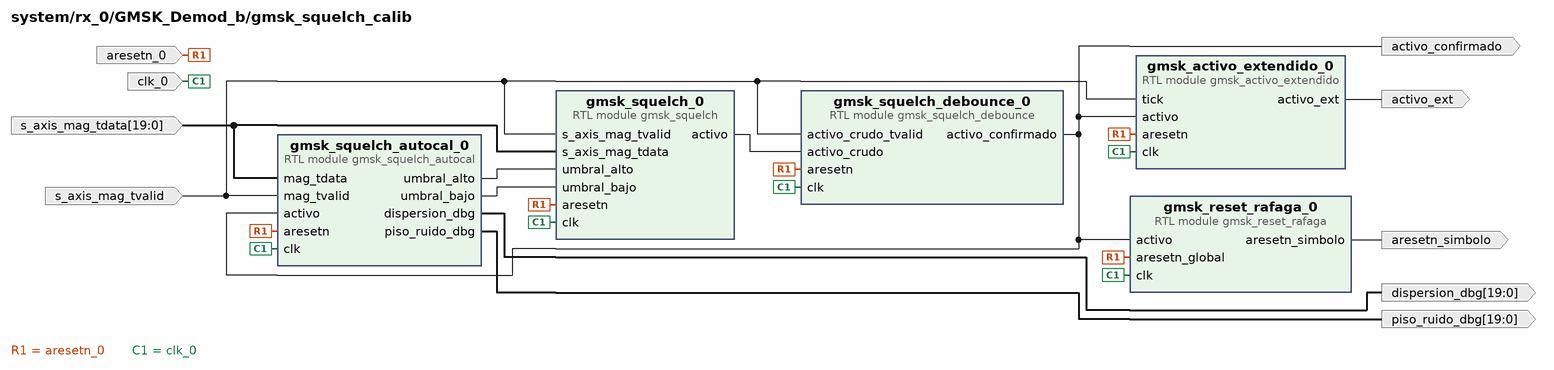
[diagram p11: block diagram inside /rx_0/GMSK_Demod_b/gmsk_squelch_calib]
create_bd_pin -dir I -type clk clk_0
create_bd_pin -dir I -type rst aresetn_0
create_bd_pin -dir O -type rst aresetn_simbolo
create_bd_pin -dir I s_axis_mag_tvalid
create_bd_pin -dir O activo_confirmado
create_bd_pin -dir I -from 19 -to 0 s_axis_mag_tdata
create_bd_pin -dir O -from 19 -to 0 piso_ruido_dbg
create_bd_pin -dir O -from 19 -to 0 dispersion_dbg
create_bd_pin -dir O activo_ext

create_bd_cell -type module -reference gmsk_squelch gmsk_squelch_0
set_property -dict {CONFIG.PHASE_WIDTH 20} [get_bd_cells gmsk_squelch_0]
create_bd_cell -type module -reference gmsk_reset_rafaga gmsk_reset_rafaga_0
set_property -dict {CONFIG.N_CICLOS_RESET 4} [get_bd_cells gmsk_reset_rafaga_0]
create_bd_cell -type module -reference gmsk_squelch_debounce gmsk_squelch_debounce_0
create_bd_cell -type module -reference gmsk_squelch_autocal gmsk_squelch_autocal_0
set_property -dict {CONFIG.DATA_WIDTH 20} [get_bd_cells gmsk_squelch_autocal_0]
create_bd_cell -type module -reference gmsk_activo_extendido gmsk_activo_extendido_0

# ---- hierarchy /rx_0/GMSK_Demod_b/gmsk_salida ----
current_bd_instance /rx_0/GMSK_Demod_b/gmsk_salida
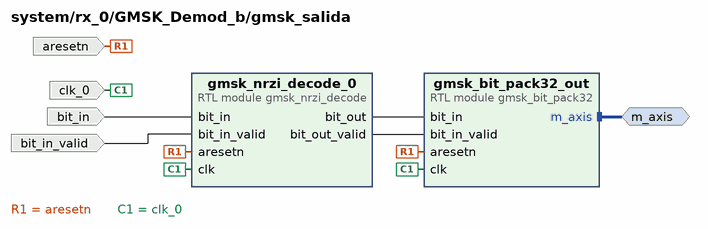
[diagram p12: block diagram inside /rx_0/GMSK_Demod_b/gmsk_salida]
create_bd_intf_pin -mode Master -vlnv xilinx.com:interface:axis_rtl:1.0 m_axis
create_bd_pin -dir I -type clk clk_0
create_bd_pin -dir I bit_in
create_bd_pin -dir I bit_in_valid
create_bd_pin -dir I -type rst aresetn

create_bd_cell -type module -reference gmsk_nrzi_decode gmsk_nrzi_decode_0
create_bd_cell -type module -reference gmsk_bit_pack32 gmsk_bit_pack32_out

# ---- hierarchy /rx_0/GMSK_Demod_b/gmsk_simbolo ----
current_bd_instance /rx_0/GMSK_Demod_b/gmsk_simbolo
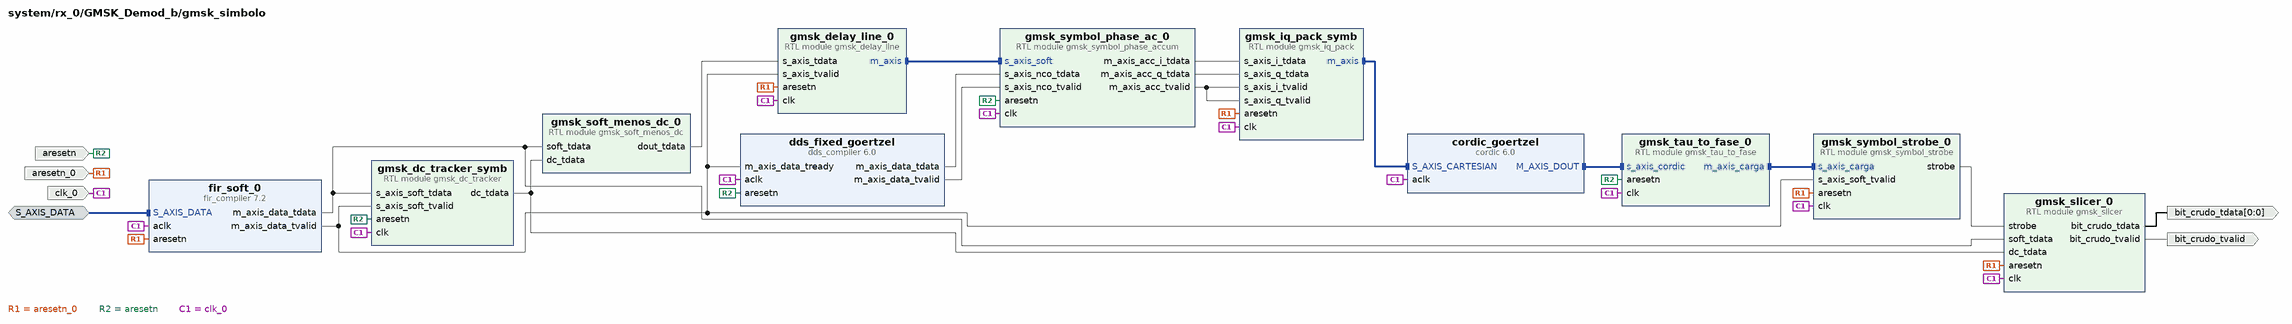
[diagram p13: block diagram inside /rx_0/GMSK_Demod_b/gmsk_simbolo]
create_bd_intf_pin -mode Slave -vlnv xilinx.com:interface:axis_rtl:1.0 S_AXIS_DATA
create_bd_pin -dir I -type clk clk_0
create_bd_pin -dir I -type rst aresetn_0
create_bd_pin -dir O -from 0 -to 0 bit_crudo_tdata
create_bd_pin -dir O bit_crudo_tvalid
create_bd_pin -dir I -type rst aresetn

create_bd_cell -type module -reference gmsk_slicer gmsk_slicer_0
create_bd_cell -type ip -vlnv xilinx.com:ip:cordic:6.0 cordic_goertzel
set_property -dict [list \
  CONFIG.ARESETN false \
  CONFIG.Architectural_Configuration Parallel \
  CONFIG.Compensation_Scaling No_Scale_Compensation \
  CONFIG.Data_Format SignedFraction \
  CONFIG.Functional_Selection Translate \
  CONFIG.Input_Width 24 \
  CONFIG.Output_Width 16 \
  CONFIG.Phase_Format Radians \
  CONFIG.Pipelining_Mode Maximum \
] [get_bd_cells cordic_goertzel]
create_bd_cell -type module -reference gmsk_delay_line gmsk_delay_line_0
set_property -dict {CONFIG.DELAY 12} [get_bd_cells gmsk_delay_line_0]
create_bd_cell -type ip -vlnv xilinx.com:ip:dds_compiler:6.0 dds_fixed_goertzel
set_property -dict [list \
  CONFIG.DATA_Has_TLAST Not_Required \
  CONFIG.DDS_Clock_Rate 0.192012289 \
  CONFIG.DSP48_Use Minimal \
  CONFIG.Frequency_Resolution 0.2 \
  CONFIG.Has_ARESETn true \
  CONFIG.Has_Phase_Out false \
  CONFIG.Has_TREADY true \
  CONFIG.Latency 12 \
  CONFIG.Negative_Sine true \
  CONFIG.Noise_Shaping Auto \
  CONFIG.OUTPUT_FORM Twos_Complement \
  CONFIG.Output_Frequency1 0.0096 \
  CONFIG.Output_Width 24 \
  CONFIG.PINC1 1100110011001001 \
  CONFIG.Phase_Increment Fixed \
  CONFIG.Phase_Width 20 \
  CONFIG.Resync false \
  CONFIG.S_PHASE_Has_TUSER Not_Required \
  CONFIG.Spurious_Free_Dynamic_Range 138 \
] [get_bd_cells dds_fixed_goertzel]
create_bd_cell -type module -reference gmsk_dc_tracker gmsk_dc_tracker_symb
set_property -dict {CONFIG.N_RAPIDO 400 CONFIG.SHIFT 12 CONFIG.SHIFT_RAPIDO 6} [get_bd_cells gmsk_dc_tracker_symb]
create_bd_cell -type module -reference gmsk_tau_to_fase gmsk_tau_to_fase_0
create_bd_cell -type module -reference gmsk_symbol_phase_accum gmsk_symbol_phase_ac_0
set_property -dict {CONFIG.N_BLOQUE 400 CONFIG.SHIFT_SALIDA 39} [get_bd_cells gmsk_symbol_phase_ac_0]
create_bd_cell -type module -reference gmsk_iq_pack gmsk_iq_pack_symb
set_property -dict {CONFIG.DATA_WIDTH 24} [get_bd_cells gmsk_iq_pack_symb]
create_bd_cell -type module -reference gmsk_soft_menos_dc gmsk_soft_menos_dc_0
create_bd_cell -type module -reference gmsk_symbol_strobe gmsk_symbol_strobe_0
set_property -dict {CONFIG.CORR_SHIFT 1} [get_bd_cells gmsk_symbol_strobe_0]
create_bd_cell -type ip -vlnv xilinx.com:ip:fir_compiler:7.2 fir_soft_0
set_property -dict [list \
  CONFIG.BestPrecision true \
  CONFIG.Clock_Frequency 125.0 \
  CONFIG.CoefficientVector {['-1.8496877595e-04, -3.1966502107e-04, -3.9983572604e-04, -3.3380304983e-04, 5.2790132615e-07, 7.4938218967e-04, 2.0714362252e-03, 4.1213150936e-03, 7.0296910521e-03, 1.0882164433e-02,', '1.5699626911e-02, 2.1422977056e-02, 2.7904815002e-02, 3.4910084326e-02, 4.2126619127e-02, 4.9185317972e-02, 5.5688373221e-02, 6.1242822589e-02, 6.5495838016e-02, 6.8167763599e-02, 6.9079035719e-02,', '6.8167763599e-02, 6.5495838016e-02, 6.1242822589e-02, 5.5688373221e-02, 4.9185317972e-02, 4.2126619127e-02, 3.4910084326e-02, 2.7904815002e-02, 2.1422977056e-02, 1.5699626911e-02, 1.0882164433e-02,', '7.0296910521e-03, 4.1213150936e-03, 2.0714362252e-03, 7.4938218967e-04, 5.2790132615e-07, -3.3380304983e-04, -3.9983572604e-04, -3.1966502107e-04, -1.8496877595e-04']} \
  CONFIG.Coefficient_Fractional_Bits 26 \
  CONFIG.Coefficient_Sets 1 \
  CONFIG.Coefficient_Sign Signed \
  CONFIG.Coefficient_Structure Inferred \
  CONFIG.Coefficient_Width 24 \
  CONFIG.Data_Fractional_Bits 23 \
  CONFIG.Data_Sign Signed \
  CONFIG.Data_Width 24 \
  CONFIG.Filter_Architecture Systolic_Multiply_Accumulate \
  CONFIG.Has_ARESETn true \
  CONFIG.M_DATA_Has_TREADY false \
  CONFIG.Output_Rounding_Mode Convergent_Rounding_to_Even \
  CONFIG.Output_Width 24 \
  CONFIG.Quantization Quantize_Only \
  CONFIG.Sample_Frequency 0.192012289 \
] [get_bd_cells fir_soft_0]

# ---- hierarchy /vgain_ctrl ----
current_bd_instance /vgain_ctrl
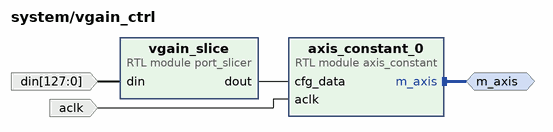
[diagram p14: block diagram inside /vgain_ctrl]
create_bd_intf_pin -mode Master -vlnv xilinx.com:interface:axis_rtl:1.0 m_axis
create_bd_pin -dir I -type clk aclk
create_bd_pin -dir I -from 127 -to 0 din

create_bd_cell -type module -reference port_slicer vgain_slice
set_property -dict {CONFIG.DIN_FROM 95 CONFIG.DIN_TO 64 CONFIG.DIN_WIDTH 128} [get_bd_cells vgain_slice]
create_bd_cell -type module -reference axis_constant axis_constant_0

# ---- connections ----

current_bd_instance /rx_0
connect_bd_intf_net [get_bd_intf_pins fifo_a/m_axis] [get_bd_intf_pins m_axis_a]
connect_bd_intf_net [get_bd_intf_pins mult_0/S_AXIS_A] [get_bd_intf_pins s_axis_adc]
connect_bd_intf_net [get_bd_intf_pins fifo_b/m_axis] [get_bd_intf_pins m_axis_b]
connect_bd_intf_net [get_bd_intf_pins GMSK_Demod_b/m_axis_salida] [get_bd_intf_pins fifo_b/s_axis]
connect_bd_intf_net [get_bd_intf_pins fifo_a/s_axis] [get_bd_intf_pins GMSK_Demod_a/m_axis_salida]
connect_bd_intf_net [get_bd_intf_pins cic_i/S_AXIS_DATA] [get_bd_intf_pins bcast_0/M00_AXIS]
connect_bd_intf_net [get_bd_intf_pins bcast_0/M01_AXIS] [get_bd_intf_pins cic_q/S_AXIS_DATA]
connect_bd_intf_net [get_bd_intf_pins bcast_b/M00_AXIS] [get_bd_intf_pins gain_ib/s_axis]
connect_bd_intf_net [get_bd_intf_pins bcast_b/M01_AXIS] [get_bd_intf_pins gain_qb/s_axis]
connect_bd_intf_net [get_bd_intf_pins cic_i/M_AXIS_DATA] [get_bd_intf_pins gmsk_axis_broadcast2_i/s_axis]
connect_bd_intf_net [get_bd_intf_pins gmsk_axis_broadcast2_q/s_axis] [get_bd_intf_pins cic_q/M_AXIS_DATA]
connect_bd_intf_net [get_bd_intf_pins cordic_b/M_AXIS_DOUT] [get_bd_intf_pins bcast_b/S_AXIS]
connect_bd_intf_net [get_bd_intf_pins mult_0/S_AXIS_B] [get_bd_intf_pins nco_0/M_AXIS_DATA]
connect_bd_intf_net [get_bd_intf_pins fir_ia/M_AXIS_DATA] [get_bd_intf_pins gmsk_iq_pack_fir_a/s_axis_i]
connect_bd_intf_net [get_bd_intf_pins fir_qa/M_AXIS_DATA] [get_bd_intf_pins gmsk_iq_pack_fir_a/s_axis_q]
connect_bd_intf_net [get_bd_intf_pins fir_ib/M_AXIS_DATA] [get_bd_intf_pins gmsk_iq_pack_fir_b/s_axis_i]
connect_bd_intf_net [get_bd_intf_pins fir_qb/M_AXIS_DATA] [get_bd_intf_pins gmsk_iq_pack_fir_b/s_axis_q]
connect_bd_intf_net [get_bd_intf_pins gmsk_axis_broadcast2_q/m0_axis] [get_bd_intf_pins fir_qa/S_AXIS_DATA]
connect_bd_intf_net [get_bd_intf_pins gmsk_axis_broadcast2_i/m0_axis] [get_bd_intf_pins fir_ia/S_AXIS_DATA]
connect_bd_intf_net [get_bd_intf_pins gmsk_axis_broadcast2_i/m1_axis] [get_bd_intf_pins gmsk_iq_pack_rot/s_axis_i]
connect_bd_intf_net [get_bd_intf_pins gmsk_axis_broadcast2_q/m1_axis] [get_bd_intf_pins gmsk_iq_pack_rot/s_axis_q]
connect_bd_intf_net [get_bd_intf_pins gain_ib/m_axis] [get_bd_intf_pins fir_ib/S_AXIS_DATA]
connect_bd_intf_net [get_bd_intf_pins gain_qb/m_axis] [get_bd_intf_pins fir_qb/S_AXIS_DATA]
connect_bd_intf_net [get_bd_intf_pins gmsk_iq_pack_fir_b/m_axis] [get_bd_intf_pins GMSK_Demod_b/s_axis]
connect_bd_intf_net [get_bd_intf_pins gmsk_iq_pack_fir_a/m_axis] [get_bd_intf_pins GMSK_Demod_a/s_axis]
connect_bd_intf_net [get_bd_intf_pins gmsk_iq_pack_rot/m_axis] [get_bd_intf_pins cordic_b/S_AXIS_CARTESIAN]
connect_bd_intf_net [get_bd_intf_pins mult_0/S_AXIS_CTRL] [get_bd_intf_pins lfsr_0/m_axis]
connect_bd_intf_net [get_bd_intf_pins bcast_0/S_AXIS] [get_bd_intf_pins mult_0/M_AXIS_DOUT]
connect_bd_intf_net [get_bd_intf_pins nco_0/S_AXIS_PHASE] [get_bd_intf_pins phase_0/m_axis]
connect_bd_intf_net [get_bd_intf_pins rot_phase_gen_0/m_axis] [get_bd_intf_pins cordic_b/S_AXIS_PHASE]
connect_bd_net -net GMSK_Demod1_activo_confirmado [get_bd_pins GMSK_Demod_b/activo_confirmado] [get_bd_pins xlconcat_b/In2]
connect_bd_net -net GMSK_Demod1_activo_ext [get_bd_pins GMSK_Demod_b/activo_ext] [get_bd_pins xlconcat_b/In5]
connect_bd_net -net GMSK_Demod1_dispersion_dbg [get_bd_pins GMSK_Demod_b/dispersion_dbg] [get_bd_pins xlconcat_b/In4]
connect_bd_net -net GMSK_Demod1_nivel [get_bd_pins GMSK_Demod_b/nivel] [get_bd_pins xlconcat_b/In1]
connect_bd_net -net GMSK_Demod1_pico_cont [get_bd_pins GMSK_Demod_b/pico_cont] [get_bd_pins xlconcat_b/In7]
connect_bd_net -net GMSK_Demod1_piso_ruido_dbg [get_bd_pins GMSK_Demod_b/piso_ruido_dbg] [get_bd_pins xlconcat_b/In3]
connect_bd_net -net GMSK_Demod1_rafaga_info [get_bd_pins GMSK_Demod_b/rafaga_info] [get_bd_pins xlconcat_b/In8]
connect_bd_net -net GMSK_Demod_activo_confirmado [get_bd_pins GMSK_Demod_a/activo_confirmado] [get_bd_pins xlconcat_a/In2]
connect_bd_net -net GMSK_Demod_activo_ext [get_bd_pins GMSK_Demod_a/activo_ext] [get_bd_pins xlconcat_a/In5]
connect_bd_net -net GMSK_Demod_dispersion_dbg [get_bd_pins GMSK_Demod_a/dispersion_dbg] [get_bd_pins xlconcat_a/In4]
connect_bd_net -net GMSK_Demod_nivel [get_bd_pins GMSK_Demod_a/nivel] [get_bd_pins xlconcat_a/In1]
connect_bd_net -net GMSK_Demod_pico_cont [get_bd_pins GMSK_Demod_a/pico_cont] [get_bd_pins xlconcat_a/In7]
connect_bd_net -net GMSK_Demod_piso_ruido_dbg [get_bd_pins GMSK_Demod_a/piso_ruido_dbg] [get_bd_pins xlconcat_a/In3]
connect_bd_net -net GMSK_Demod_rafaga_info [get_bd_pins GMSK_Demod_a/rafaga_info] [get_bd_pins xlconcat_a/In8]
connect_bd_net [get_bd_pins aclk] \
  [get_bd_pins phase_0/aclk] [get_bd_pins nco_0/aclk] [get_bd_pins mult_0/aclk] [get_bd_pins bcast_0/aclk] \
  [get_bd_pins cic_i/aclk] [get_bd_pins fifo_a/aclk] [get_bd_pins cic_q/aclk] [get_bd_pins fir_ia/aclk] \
  [get_bd_pins GMSK_Demod_a/clk_0] [get_bd_pins fir_qa/aclk] [get_bd_pins lfsr_0/aclk] [get_bd_pins gmsk_iq_pack_fir_a/clk] \
  [get_bd_pins fir_ib/aclk] [get_bd_pins fir_qb/aclk] [get_bd_pins GMSK_Demod_b/clk_0] [get_bd_pins gmsk_iq_pack_fir_b/clk] \
  [get_bd_pins fifo_b/aclk] [get_bd_pins cordic_b/aclk] [get_bd_pins bcast_b/aclk] [get_bd_pins rot_phase_gen_0/aclk] \
  [get_bd_pins gmsk_axis_broadcast2_q/clk] [get_bd_pins gmsk_axis_broadcast2_i/clk] [get_bd_pins gmsk_iq_pack_rot/clk] \
  [get_bd_pins gain_qb/clk] [get_bd_pins gain_ib/clk]
connect_bd_net -net aresetn_0_1 [get_bd_pins aresetn_0] \
  [get_bd_pins bcast_0/aresetn] [get_bd_pins cic_i/aresetn] [get_bd_pins cic_q/aresetn] [get_bd_pins fir_ia/aresetn] \
  [get_bd_pins fir_qa/aresetn] [get_bd_pins GMSK_Demod_a/aresetn_0] [get_bd_pins lfsr_0/aresetn] \
  [get_bd_pins gmsk_iq_pack_fir_a/aresetn] [get_bd_pins fir_ib/aresetn] [get_bd_pins fir_qb/aresetn] \
  [get_bd_pins gmsk_iq_pack_fir_b/aresetn] [get_bd_pins GMSK_Demod_b/aresetn_0] [get_bd_pins bcast_b/aresetn] \
  [get_bd_pins rot_phase_gen_0/aresetn] [get_bd_pins gmsk_axis_broadcast2_q/aresetn] \
  [get_bd_pins gmsk_axis_broadcast2_i/aresetn] [get_bd_pins gmsk_iq_pack_rot/aresetn] [get_bd_pins gain_qb/aresetn] \
  [get_bd_pins gain_ib/aresetn]
connect_bd_net -net fifo_0_read_count [get_bd_pins fifo_a/read_count] [get_bd_pins xlconcat_a/In0]
connect_bd_net -net fifo_1_read_count [get_bd_pins fifo_b/read_count] [get_bd_pins xlconcat_b/In0]
connect_bd_net -net hub_0_cfg_data [get_bd_pins din] [get_bd_pins slice_1/din] [get_bd_pins slice_0/din] [get_bd_pins mux_out_sel_slice/din]
connect_bd_net -net sel_out_1 [get_bd_pins mux_out_sel_slice/dout] [get_bd_pins GMSK_Demod_a/sel_out] [get_bd_pins GMSK_Demod_b/sel_out]
connect_bd_net [get_bd_pins slice_0/dout] [get_bd_pins fifo_a/aresetn] [get_bd_pins fifo_b/aresetn]
connect_bd_net [get_bd_pins slice_1/dout] [get_bd_pins phase_0/cfg_data]
connect_bd_net -net xlconcat_0_dout [get_bd_pins xlconcat_a/dout] [get_bd_pins xlconcat_ab/In0]
connect_bd_net -net xlconcat_1_dout [get_bd_pins xlconcat_b/dout] [get_bd_pins xlconcat_ab/In1]
connect_bd_net -net xlconcat_2_dout [get_bd_pins xlconcat_ab/dout] [get_bd_pins dout]
connect_bd_net [get_bd_pins xlconstant_0/dout] [get_bd_pins xlconcat_a/In6] [get_bd_pins xlconcat_b/In6]
connect_bd_net [get_bd_pins xlconstant_pinc_rot/dout] [get_bd_pins rot_phase_gen_0/pinc]
